# Altium schematic sheet Connector_Sheet.SchDoc
size A4; DocumentNumber: 1; SheetNumber: 10; SheetTotal: 10
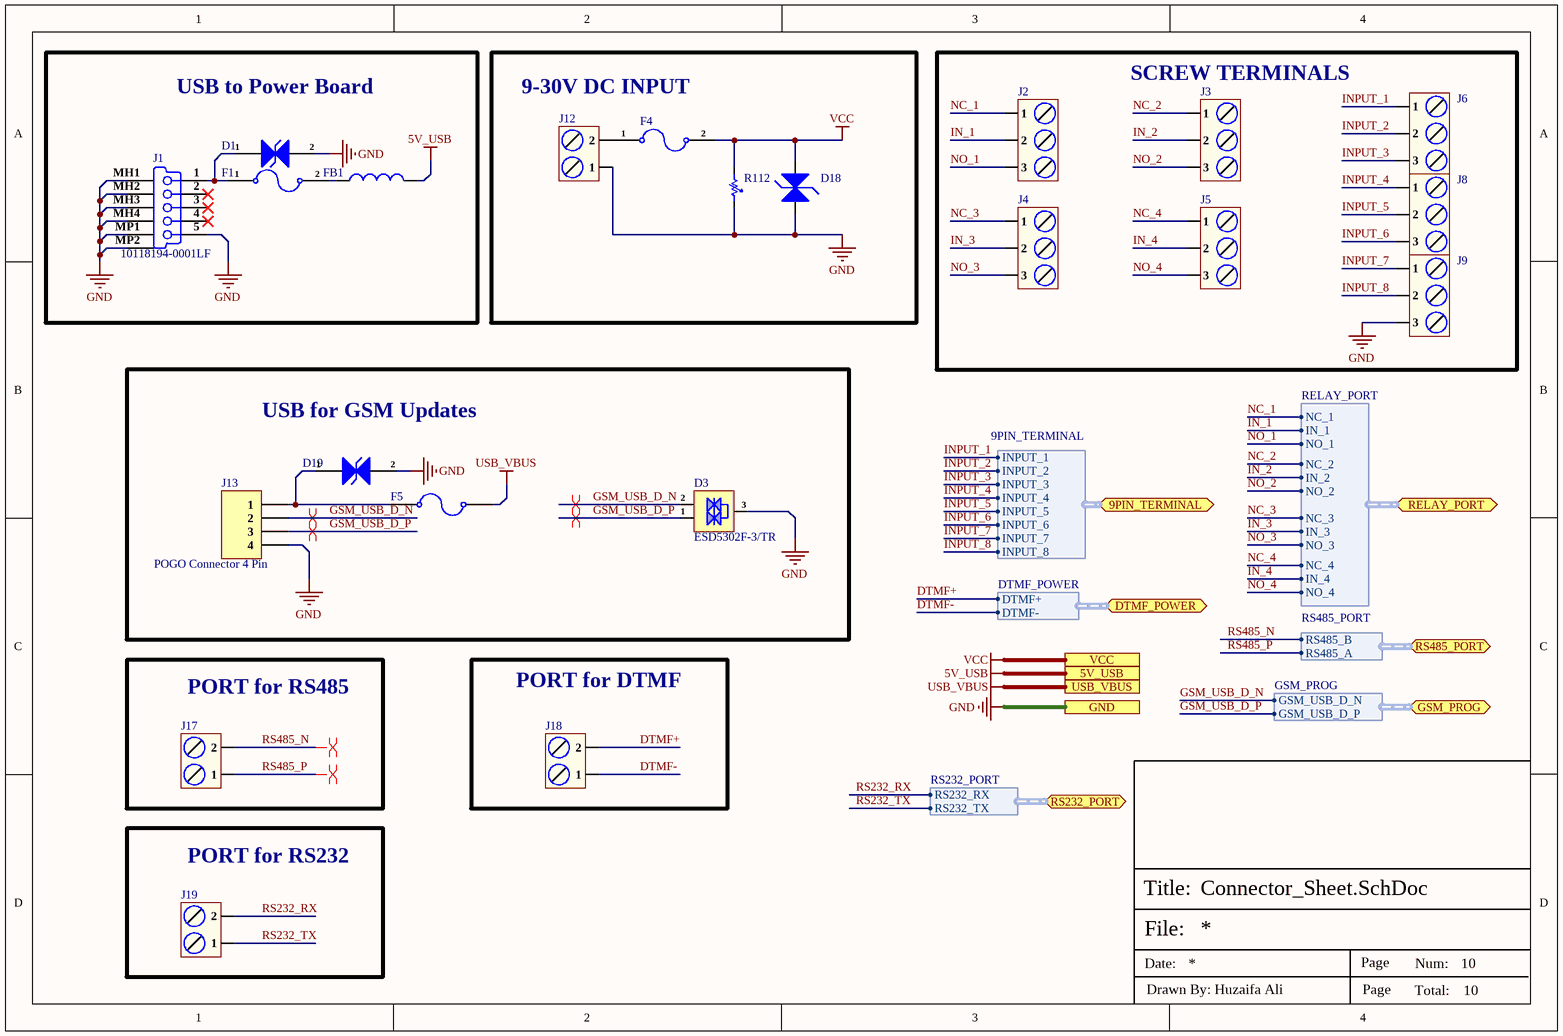
[diagram p0: Connector_Sheet.SchDoc]

## Parts
D1  PESD5V0H1BSFYL  [DSN0603-2]  (value not drawn)
D3  ESD5302F-3/TR  [Sot-23]
D18  SMBJ36CA  [SMB_]  (value not drawn)
D19  PESD5V0H1BSFYL  [DSN0603-2]  (value not drawn)
F1  1206L300SLTHYR  [Fuse 1206 (3216 Metric)]  (value not drawn)
F4  SHV2920P500-30-AA  [Fuse-2920]  (value not drawn)
F5  SMD0603-050  [Fuse-0603]  (value not drawn)
FB1  100MHz  [IND-1206]  (value not drawn)
J1  10118194-0001LF  [10118194-0001LF_]
J2  DB128L-5.08-3P-BK-S  [DB128L-5.08-3P-BK-S]  (value not drawn)
J3  DB128L-5.08-3P-BK-S  [DB128L-5.08-3P-BK-S]  (value not drawn)
J4  DB128L-5.08-3P-BK-S  [DB128L-5.08-3P-BK-S]  (value not drawn)
J5  DB128L-5.08-3P-BK-S  [DB128L-5.08-3P-BK-S]  (value not drawn)
J6  DB128L-5.08-3P-BK-S  [DB128L-5.08-3P-BK-S]  (value not drawn)
J8  DB128L-5.08-3P-BK-S  [DB128L-5.08-3P-BK-S]  (value not drawn)
J9  DB128L-5.08-3P-BK-S  [DB128L-5.08-3P-BK-S]  (value not drawn)
J12  DB128L-5.08-2P-BK-S  [DB128L-5.08-2P-BK-S]  (value not drawn)
J13  POGO Connector 4 Pin  [Pogo 4 Pin]
J17  DB128L-5.08-2P-BK-S  [DB128L-5.08-2P-BK-S]  (value not drawn)
J18  DB128L-5.08-2P-BK-S  [DB128L-5.08-2P-BK-S]  (value not drawn)
J19  DB128L-5.08-2P-BK-S  [DB128L-5.08-2P-BK-S]  (value not drawn)
R112  B72210S0300K101  [B72210S0300K101]  (value not drawn)

## Blocks framed on the sheet
USB to Power Board: D1 F1 FB1 J1
9-30V DC INPUT: D18 F4 J12 R112
SCREW TERMINALS: J2-J6 J8 J9
USB for GSM Updates: D3 D19 F5 J13
PORT for RS485: J17
PORT for DTMF: J18
PORT for RS232: J19

## Ports
5V_USB, 9PIN_TERMINAL (bidir, harness 9PIN_TERMINAL), DTMF_POWER (bidir, harness DTMF_POWER), GND, GSM_PROG (bidir, harness GSM_PROG), RELAY_PORT (bidir, harness RELAY_PORT), RS232_PORT (bidir, harness RS232_PORT), RS485_PORT (bidir, harness RS485_PORT), USB_VBUS, VCC

## Harnesses
GSM_PROG: GSM_USB_D_N, GSM_USB_D_P
RS485_PORT: RS485_B, RS485_A
RELAY_PORT: NC_1, NC_2, IN_1, IN_2, NO_1, NO_2, NC_3, NC_4, IN_3, IN_4, NO_3, NO_4
9PIN_TERMINAL: INPUT_1, INPUT_2, INPUT_3, INPUT_4, INPUT_5, INPUT_6, INPUT_7, INPUT_8
DTMF_POWER: DTMF+, DTMF-
RS232_PORT: RS232_RX, RS232_TX

## Nets
5V_USB: FB1.2 ; port 5V_USB
GND: D1.2 D3.3(GND) D18.1(A) D19.2 J1.5(GND) J1.MH1(Tab) J1.MH2(Tab) J1.MH3(Tab) J1.MH4(Tab) J1.MP1(Tab) J1.MP2(Tab) J9.3 J12.1 J13.4 R112.2 ; port GND
USB_VBUS: F5.2 ; port USB_VBUS
VCC: D18.2(A) F4.2 R112.1 ; port VCC
DTMF+: J18.2 ; port DTMF_POWER.DTMF+
DTMF-: J18.1 ; port DTMF_POWER.DTMF-
GSM_USB_D_N: D3.2(I/O2) J13.2 ; port GSM_PROG.GSM_USB_D_N
GSM_USB_D_P: D3.1(I/O1) J13.3 ; port GSM_PROG.GSM_USB_D_P
IN_1: J2.2 ; port RELAY_PORT.IN_1
IN_2: J3.2 ; port RELAY_PORT.IN_2
IN_3: J4.2 ; port RELAY_PORT.IN_3
IN_4: J5.2 ; port RELAY_PORT.IN_4
INPUT_1: J6.1 ; port 9PIN_TERMINAL.INPUT_1
INPUT_2: J6.2 ; port 9PIN_TERMINAL.INPUT_2
INPUT_3: J6.3 ; port 9PIN_TERMINAL.INPUT_3
INPUT_4: J8.1 ; port 9PIN_TERMINAL.INPUT_4
INPUT_5: J8.2 ; port 9PIN_TERMINAL.INPUT_5
INPUT_6: J8.3 ; port 9PIN_TERMINAL.INPUT_6
INPUT_7: J9.1 ; port 9PIN_TERMINAL.INPUT_7
INPUT_8: J9.2 ; port 9PIN_TERMINAL.INPUT_8
NC_1: J2.1 ; port RELAY_PORT.NC_1
NC_2: J3.1 ; port RELAY_PORT.NC_2
NC_3: J4.1 ; port RELAY_PORT.NC_3
NC_4: J5.1 ; port RELAY_PORT.NC_4
NO_1: J2.3 ; port RELAY_PORT.NO_1
NO_2: J3.3 ; port RELAY_PORT.NO_2
NO_3: J4.3 ; port RELAY_PORT.NO_3
NO_4: J5.3 ; port RELAY_PORT.NO_4
RS232_RX: J19.2 ; port RS232_PORT.RS232_RX
RS232_TX: J19.1 ; port RS232_PORT.RS232_TX
RS485_N: J17.2 ; port RS485_PORT.RS485_B
RS485_P: J17.1 ; port RS485_PORT.RS485_A
NetD1_1: D1.1 F1.1 J1.1(V_BUS_(5V))
NetD19_1: D19.1 F5.1 J13.1
NetF1_2: F1.2 FB1.1
NetF4_1: F4.1 J12.2

Not connected (* = marked no-connect by the designer): J1 2(D-)* 3(D+)* 4(NC)*

## Layout directives
differential pair; net class GSM_USB; differential pair class GSM_USB_Lines; rule Impedance Constraint [Min = 85.00    Max = 90.00    ]; rule Matched Net Lengths [Tolerance = 50mil]: GSM_USB_D_N, GSM_USB_D_P
differential pair; net class RS485; differential pair class RS485_LINES; rule Impedance Constraint [Min = 115.0    Max = 120.0    ]; rule Matched Net Lengths [Tolerance = 0.508mm]: RS485_N, RS485_P

## Notes on the sheet
- File:
- Title:
- Date:
- Page
- Num:
- Total:
- Drawn By: Huzaifa Ali

## Library data of the parts
D1 D19 = PESD5V0H1BSFYL: TVS DIODE 5VWM 6.3VC DSN0603-2; Manufacturer: Nexperia; Supplier 1: Avnet; Manufacturer Part Number: PESD5V0H1BSFYL; RoHS: Yes; Category: ESD and Circuit Protection ICs; Stock 1: 9000; Pricing 1: 18000=0.06453, 36000=0.06278, 54000=0.06104, 90000=0.05930, 180000=0.05755, 900000=0.05581, 1800000=0.05406 (USD); RoHS Compliant: Yes; ComponentLink1URL: http://www.farnell.com/datasheets/1961312.pdf?src-supplier=Farnell; ComponentLink1Description: http://www.farnell.com/datasheets/1961312.pdf?src-supplier=Farnell; ComponentLink2URL: https://assets.nexperia.com/documents/data-sheet/PESD5V0H1BSF.pdf?src-supplier=Digi-Key; ComponentLink2Description: https://assets.nexperia.com/documents/data-sheet/PESD5V0H1BSF.pdf?src-supplier=Digi-Key; ComponentLink3URL: http://www.farnell.com/datasheets/1961312.pdf?src-supplier=Newark; ComponentLink3Description: http://www.farnell.com/datasheets/1961312.pdf?src-supplier=Newark; Supplier Part Number 1: PESD5V0H1BSFYL; LCSC Part Number: C477989; Item Type: Diode
D3 = ESD5302F-3/TR: 16A 20V 7V 5V@Max Unidirectional SOT-23 TVS ROHS; Manufacturer: WILLSEMI; Item Type: Diode; Manufacturer Part Number: ESD5302F-3/TR; Package: SOT-23; LCSC Part Number: C239643; ComponentLink1Description: LCSC; ComponentLink1URL: https://www.lcsc.com/product-detail/TVS_WILLSEMI-Will-Semicon-ESD5302F-3-TR_C239643.html
D18 = SMBJ36CA: 58.1V 40V 36V Bi-Directional SMB(DO-214AA) TVS ROHS; Manufacturer: Slkor(SLKORMICRO Elec.); Item Type: Diode; Manufacturer Part Number: SMBJ36CA; Package: SMB(DO-214AA); LCSC Part Number: C556189; ComponentLink1Description: LCSC; ComponentLink1URL: https://www.lcsc.com/product-detail/span-style-background-color-ff0-TVS-span_Slkor-SLKORMICRO-Elec-SMBJ36CA_C556189.html
F1 = 1206L300SLTHYR: PTC RESET FUSE 6V 3A 1206; Manufacturer: Littelfuse; Max Current Rating: 50A; Resistance: 20mR; Power Dissipation: 800mW; Trip Current: 6A; Time to Trip: 4s; Approvals: UL,TUV; Supplier 1: Arrow Electronics; Manufacturer Part Number: 1206L300SLTHYR; RoHS: Yes; Category: PTC Resettable Fuses; Stock 1: 4000; Pricing 1: 4000=0.60290 (USD); Case/Package: 1206; Case Code (Metric): 3216; Case Code (Imperial): 1206; Min Operating Temperature: -40°C; Max Operating Temperature: 85°C; Package Quantity: 4000; Packaging: Tape and Reel; Termination: SMD/SMT; Max Voltage Rating (DC): 6V; Hold Current: 3A; Voltage Rating (DC): 6V; Operating Supply Voltage: 6V; Series: POLY-FUSE®, LoRho™; Lead Free: Lead Free; RoHS Compliant: Yes; ComponentLink1URL: https://datasheet.ciiva.com/7438/littelfuse-lorho-ptc-7438567.pdf?src-supplier=Digi-Key; ComponentLink1Description: https://datasheet.ciiva.com/7438/littelfuse-lorho-ptc-7438567.pdf?src-supplier=Digi-Key; ComponentLink2URL: https://datasheet.ciiva.com/7438/littelfuse-lorho-ptc-7438569.pdf?src-supplier=Digi-Key; ComponentLink2Description: https://datasheet.ciiva.com/7438/littelfuse-lorho-ptc-7438569.pdf?src-supplier=Digi-Key; ComponentLink3URL: https://datasheet.ciiva.com/7438/littelfuse-lorho-ptc-7438565.pdf?src-supplier=Digi-Key; ComponentLink3Description: https://datasheet.ciiva.com/7438/littelfuse-lorho-ptc-7438565.pdf?src-supplier=Digi-Key; Supplier Part Number 1: 1206L300SLTHYR; LCSC Part Number: C207041; Item Type: Fuse
F4 = SHV2920P500-30-AA: 30V 5A 5A 2920 Resettable Fuses ROHS; Manufacturer: PTTC(Polytronics Tech); Item Type: Fuse; ComponentLink1Description: LCSC; ComponentLink1URL: https://www.lcsc.com/product-detail/Resettable-Fuses_PTTC-Polytronics-Tech-SHV2920P500-30-AA_C495350.html; Manufacturer Part Number: SHV2920P500-30-AA; Package: 2920; LCSC Part Number: C495350
F5 = SMD0603-050: 6V 500mA 40A 1A 0603 Resettable Fuses ROHS; Manufacturer: TECHFUSE; Supplier 1: LCSC; Manufacturer Part Number: SMD0603-050; RoHS: No; Category: Uncategorized; Supplier Part Number 1: C69679
FB1 = BLM31PG121SN1L: FERRITE BEAD 120 OHM 1206 1LN; Manufacturer: Murata; Material: Steel,Ferrite; Tolerance: 25%; Impedance: 120R; Max Current Rating: 3.5A; Number of Lines: 1; DC Resistance (DCR): 20mR; Max DC Current: 3A; Shielding: Unshielded; Supplier 1: Avnet; Manufacturer Part Number: BLM31PG121SN1L; RoHS: Yes; Category: Ferrite Beads and Chips; Stock 1: 290640; Pricing 1: 3000=0.11563, 6000=0.10938, 12000=0.10313, 18000=0.09688, 24000=0.09063, 30000=0.08438, 300000=0.07813 (USD); Case/Package: 1206; Number of Pins: 2; Core Material: Ferrite; Case Code (Metric): 3216; Case Code (Imperial): 1206; Contact Plating: Tin,Matte; Min Operating Temperature: -55°C; Max Operating Temperature: 125°C; Package Quantity: 3000; Packaging: Tape and Reel; Current Rating: 3.5A; Termination: SMD/SMT; Test Frequency: 100MHz; DC Current: 3A; Frequency: 100MHz; Length: 3.2mm; Width: 1.6mm; Height: 1.1mm; Depth: 1.6mm; Radiation Hardening: No; Military Standard: Not; Lead Free: Lead Free; RoHS Compliant: Yes; ComponentLink1URL: https://datasheet.ciiva.com/19460/1845419-19460234.pdf?src-supplier=Jameco; ComponentLink1Description: https://datasheet.ciiva.com/19460/1845419-19460234.pdf?src-supplier=Jameco; ComponentLink2URL: https://datasheet.ciiva.com/1012/l0132s0193blm31p-1012992.pdf?src-supplier=Digi-Key; ComponentLink2Description: https://datasheet.ciiva.com/1012/l0132s0193blm31p-1012992.pdf?src-supplier=Digi-Key; ComponentLink3URL: https://datasheet.ciiva.com/11799/0900766b811b5866-11799444.pdf?src-supplier=RSComponents; ComponentLink3Description: https://datasheet.ciiva.com/11799/0900766b811b5866-11799444.pdf?src-supplier=RSComponents; ComponentLink4URL: https://datasheet.ciiva.com/3081/l0110s0100blm31p-3081665.pdf?src-supplier=Avnet; ComponentLink4Description: https://datasheet.ciiva.com/3081/l0110s0100blm31p-3081665.pdf?src-supplier=Avnet; ComponentLink5URL: https://datasheet.ciiva.com/41449/001172383-da-01-en-drossel-1206-120r-3-2x1-60mm-3000st-41449554.pdf?src-supplier=Conrad; ComponentLink5Description: https://datasheet.ciiva.com/41449/001172383-da-01-en-drossel-1206-120r-3-2x1-60mm-3000st-41449554.pdf?src-supplier=Conrad; ComponentLink6URL: https://datasheet.ciiva.com/29348/442557-da-01-en-chip-drossel-1206-120r-3000ma-3-2x1-60mm-29348014.pdf?src-supplier=Conrad; ComponentLink6Description: https://datasheet.ciiva.com/29348/442557-da-01-en-chip-drossel-1206-120r-3000ma-3-2x1-60mm-29348014.pdf?src-supplier=Conrad; ComponentLink7URL: https://datasheet.ciiva.com/14122/apblm31p-data-e-14122856.pdf?src-supplier=Distrelec; ComponentLink7Description: https://datasheet.ciiva.com/14122/apblm31p-data-e-14122856.pdf?src-supplier=Distrelec; ComponentLink8URL: https://datasheet.ciiva.com/48436/blm31pg121sn1l-eng-tds-48436731.pdf?src-supplier=Distrelec; ComponentLink8Description: https://datasheet.ciiva.com/48436/blm31pg121sn1l-eng-tds-48436731.pdf?src-supplier=Distrelec; ComponentLink9URL: https://datasheet.ciiva.com/1012/l0110s0100blm31p-1012991.pdf?src-supplier=Digi-Key; ComponentLink9Description: https://datasheet.ciiva.com/1012/l0110s0100blm31p-1012991.pdf?src-supplier=Digi-Key; ComponentLink10URL: https://datasheet.ciiva.com/1012/l0110s0100blm31p-1012993.pdf?src-supplier=Digi-Key; ComponentLink10Description: https://datasheet.ciiva.com/1012/l0110s0100blm31p-1012993.pdf?src-supplier=Digi-Key; ComponentLink11URL: https://datasheet.ciiva.com/3081/l0110s0100blm31p-3081666.pdf?src-supplier=Avnet; ComponentLink11Description: https://datasheet.ciiva.com/3081/l0110s0100blm31p-3081666.pdf?src-supplier=Avnet; ComponentLink12URL: https://datasheet.ciiva.com/16390/l0110s0100blm31p-16390857.pdf?src-supplier=Future+Electronics; ComponentLink12Description: https://datasheet.ciiva.com/16390/l0110s0100blm31p-16390857.pdf?src-supplier=Future+Electronics; ComponentLink13URL: https://datasheet.ciiva.com/18093/getdatasheetpartid-152966-18093084.pdf?src-supplier=Verical; ComponentLink13Description: https://datasheet.ciiva.com/18093/getdatasheetpartid-152966-18093084.pdf?src-supplier=Verical; Supplier Part Number 1: BLM31PG121SN1L; LCSC Part Number: C85841; Item Type: Ferrite Bead
J1 = 10118194-0001LF: CONN RCPT USB2.0 MICRO B SMD R/A; Manufacturer: Amphenol FCI; Gender: Receptacle; Current Rating: 1.8A; Connector Type: USB,Receptacle; Number of Contacts: 5; Insulation Resistance: 1GR; Number of Ports: 1; Max Voltage Rating (AC): 100V; Pitch: 0.65mm; Item Type: USB Connector; Supplier 1: Digi-Key; Manufacturer Part Number: 10118194-0001LF; Stock 1: 35943; Pricing 1: 1=0.43, 10=0.405, 25=0.3648, 50=0.3242, 100=0.3107, 250=0.28368, 500=0.27016 (USD); Mount: Surface Mount,Horizontal; Color: Black; Contact Material: Copper Alloy; Contact Plating: Gold; Number of Terminals: 5; Housing Material: Polymer; Min Operating Temperature: -55°C; Max Operating Temperature: 85°C; Package Quantity: 9600; Packaging: Tape and Reel; Termination: Solder; Orientation: Right Angle; Features: Shielded; Length: 8.05mm; Depth: 5mm; Radiation Hardening: No; Lead Free: Lead Free; Flammability Rating: UL94 V-0; ComponentLink1URL: http://www.amphenol-icc.com/media/wysiwyg/files/drawing/10118194.pdf?src-supplier=Digi-Key; ComponentLink1Description: http://www.amphenol-icc.com/media/wysiwyg/files/drawing/10118194.pdf?src-supplier=Digi-Key; ComponentLink2URL: https://cdn.amphenol-icc.com/media/wysiwyg/files/drawing/10118194.pdf?src-supplier=Mouser; ComponentLink2Description: https://cdn.amphenol-icc.com/media/wysiwyg/files/drawing/10118194.pdf?src-supplier=Mouser; ComponentLink3URL: https://cdn.amphenol-icc.com/media/wysiwyg/files/drawing/10118194.pdf?src-supplier=Verical; ComponentLink3Description: https://cdn.amphenol-icc.com/media/wysiwyg/files/drawing/10118194.pdf?src-supplier=Verical; Supplier Part Number 1: 609-4618-1-ND; LCSC Part Number: C132563
J2-J6 J8 J9 = DB128L-5.08-3P-BK-S: 1x3P 18A -40℃~+105℃ 250V Black 12~30 Straight pin 5.08mm 2.5 1 3 Plugin,P=5.08mm Screw terminal ROHS; Manufacturer: DIBO; Item Type: Terminal Block; Manufacturer Part Number: DB128L-5.08-3P-BK-S; Package: Plugin,P=5.08mm; LCSC Part Number: C430602; ComponentLink1Description: LCSC; ComponentLink1URL: https://www.lcsc.com/product-detail/Screw-terminal_DIBO-DB128L-5-08-3P-BK-S_C430602.html
J12 J17-J19 = DB128L-5.08-2P-BK-S: 1x2P 18A -40℃~+105℃ 250V Black 12~30 Straight pin 5.08mm 2.5 1 2 Plugin,P=5.08mm Screw terminal ROHS; Manufacturer: DIBO; Item Type: Terminal Block; Manufacturer Part Number: DB128L-5.08-2P-BK-S; Package: Plugin,P=5.08mm; LCSC Part Number: C430601; ComponentLink1Description: LCSC; ComponentLink1URL: https://www.lcsc.com/product-detail/Screw-terminal_span-style-background-color-ff0-DIBO-span-DB128L-5-08-2P-BK-S_C430601.html
J13 = POGO Connector 4 Pin: Pogo Pad 2.5mm 4 Pin; Item Type: Pogo Connector; Manufacturer Part Number: POGO Connector 4 Pin
R112 = B72210S0300K101: VARISTOR 47V 500A DISC 10MM; Manufacturer: TDK EPCOS; Voltage Rating (DC): 38V; Voltage Rating (AC): 30V; Value: 2.75nF; Clamping Voltage: 93V; Clamping Current: 5A; Energy: 4.4J; Lead/Base Style: Radial; Tolerance: 10%; Number of Circuits: 1; Min Varistor Voltage: 42.3V; Max Varistor Voltage: 51.7V; Lead Length: 30mm; Supplier 1: Arrow Electronics; Manufacturer Part Number: B72210S0300K101; RoHS: Yes; Category: Varistors; Stock 1: 14838; Pricing 1: 1=0.3862, 10=0.3035, 25=0.3004, 100=0.2152, 250=0.215, 500=0.1646, 1000=0.1301, 2500=0.1213, 5000=0.1048 (USD); Mounting Technology: Through Hole,Radial; Min Operating Temperature: -40°C; Max Operating Temperature: 85°C; Max Surge Current: 500A; Packaging: Bulk; Max Voltage Rating (DC): 38V; Max Voltage Rating (AC): 30V; Varistor Voltage: 47V; Series: Standard; Package Quantity: 500; Diameter: 10mm; Lead Pitch: 7.5mm; Depth: 4.4mm; Thickness: 4.4mm; Reach SVHC Compliant: No; RoHS Compliant: Yes; ComponentLink1URL: https://datasheet.ciiva.com/11834/0900766b80188ddb-11834267.pdf?src-supplier=Rs; ComponentLink1Description: https://datasheet.ciiva.com/11834/0900766b80188ddb-11834267.pdf?src-supplier=Rs; ComponentLink2URL: https://datasheet.ciiva.com/15155/getdatasheetpartid-111496-15155493.pdf?src-supplier=Verical; ComponentLink2Description: https://datasheet.ciiva.com/15155/getdatasheetpartid-111496-15155493.pdf?src-supplier=Verical; ComponentLink3URL: https://datasheet.ciiva.com/1277/1899727-1277935.pdf?src-supplier=Element14; ComponentLink3Description: https://datasheet.ciiva.com/1277/1899727-1277935.pdf?src-supplier=Element14; Supplier Part Number 1: B72210S0300K101; LCSC Part Number: C125513; Item Type: Varistor